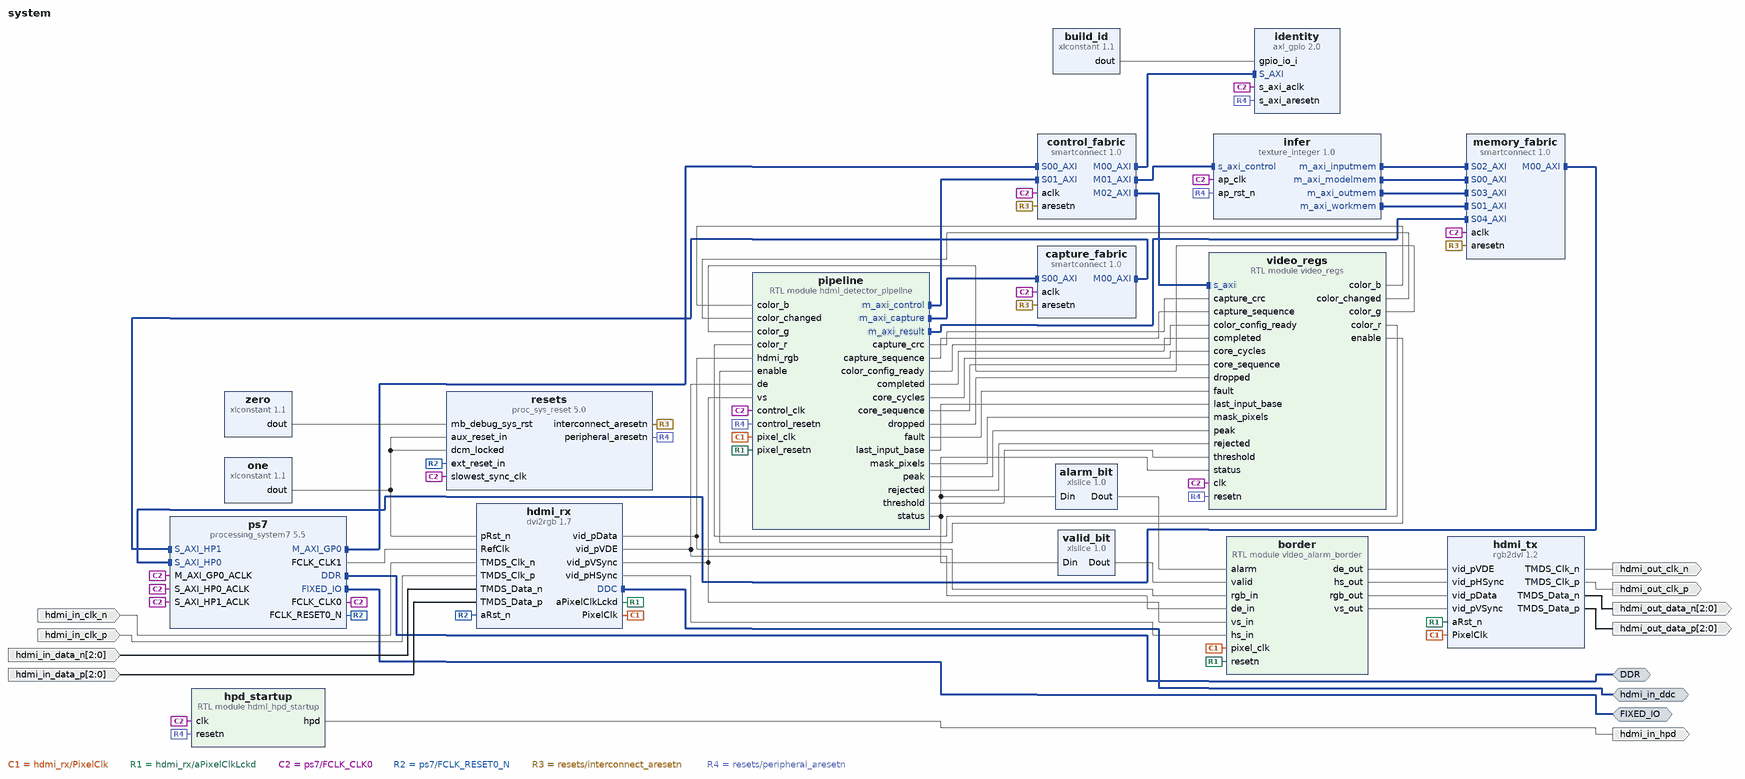
[diagram p0: block diagram of the top level]
# Vivado block design system, xc7z020clg400-1, Vivado 2025.2
create_bd_design system

create_bd_intf_port -mode Master -vlnv xilinx.com:interface:ddrx_rtl:1.0 DDR
create_bd_intf_port -mode Master -vlnv xilinx.com:display_processing_system7:fixedio_rtl:1.0 FIXED_IO
create_bd_intf_port -mode Master -vlnv xilinx.com:interface:iic_rtl:1.0 hdmi_in_ddc
create_bd_port -dir I hdmi_in_clk_p
create_bd_port -dir I hdmi_in_clk_n
create_bd_port -dir I -from 2 -to 0 hdmi_in_data_p
create_bd_port -dir I -from 2 -to 0 hdmi_in_data_n
create_bd_port -dir O hdmi_out_clk_p
create_bd_port -dir O hdmi_out_clk_n
create_bd_port -dir O -from 2 -to 0 hdmi_out_data_p
create_bd_port -dir O -from 2 -to 0 hdmi_out_data_n
create_bd_port -dir O hdmi_in_hpd

create_bd_cell -type ip -vlnv xilinx.com:ip:processing_system7:5.5 ps7
set_property -dict [list \
  CONFIG.PCW_APU_PERIPHERAL_FREQMHZ 650 \
  CONFIG.PCW_CRYSTAL_PERIPHERAL_FREQMHZ 50 \
  CONFIG.PCW_ENET0_ENET0_IO {MIO 16 .. 27} \
  CONFIG.PCW_ENET0_GRP_MDIO_ENABLE 1 \
  CONFIG.PCW_ENET0_GRP_MDIO_IO {MIO 52 .. 53} \
  CONFIG.PCW_ENET0_PERIPHERAL_ENABLE 1 \
  CONFIG.PCW_ENET0_RESET_ENABLE 1 \
  CONFIG.PCW_ENET0_RESET_IO {MIO 9} \
  CONFIG.PCW_ENET_RESET_ENABLE 1 \
  CONFIG.PCW_ENET_RESET_SELECT {Share reset pin} \
  CONFIG.PCW_EN_CLK1_PORT 1 \
  CONFIG.PCW_FPGA0_PERIPHERAL_FREQMHZ 100 \
  CONFIG.PCW_FPGA1_PERIPHERAL_FREQMHZ 200 \
  CONFIG.PCW_FPGA2_PERIPHERAL_FREQMHZ 200 \
  CONFIG.PCW_FPGA3_PERIPHERAL_FREQMHZ 166.67 \
  CONFIG.PCW_FPGA_FCLK1_ENABLE 1 \
  CONFIG.PCW_GPIO_MIO_GPIO_ENABLE 1 \
  CONFIG.PCW_GPIO_MIO_GPIO_IO MIO \
  CONFIG.PCW_I2C_RESET_ENABLE 1 \
  CONFIG.PCW_IRQ_F2P_INTR 1 \
  CONFIG.PCW_PERIPHERAL_BOARD_PRESET None \
  CONFIG.PCW_PRESET_BANK1_VOLTAGE {LVCMOS 1.8V} \
  CONFIG.PCW_QSPI_GRP_FBCLK_ENABLE 1 \
  CONFIG.PCW_QSPI_GRP_FBCLK_IO {MIO 8} \
  CONFIG.PCW_QSPI_GRP_SINGLE_SS_ENABLE 1 \
  CONFIG.PCW_QSPI_GRP_SINGLE_SS_IO {MIO 1 .. 6} \
  CONFIG.PCW_QSPI_PERIPHERAL_ENABLE 1 \
  CONFIG.PCW_QSPI_QSPI_IO {MIO 1 .. 6} \
  CONFIG.PCW_SD0_GRP_CD_ENABLE 1 \
  CONFIG.PCW_SD0_GRP_CD_IO {MIO 47} \
  CONFIG.PCW_SD0_GRP_WP_ENABLE 0 \
  CONFIG.PCW_SD0_PERIPHERAL_ENABLE 1 \
  CONFIG.PCW_SD0_SD0_IO {MIO 40 .. 45} \
  CONFIG.PCW_SDIO_PERIPHERAL_FREQMHZ 50 \
  CONFIG.PCW_SINGLE_QSPI_DATA_MODE x4 \
  CONFIG.PCW_UART0_PERIPHERAL_ENABLE 1 \
  CONFIG.PCW_UART0_UART0_IO {MIO 14 .. 15} \
  CONFIG.PCW_UART1_PERIPHERAL_ENABLE 0 \
  CONFIG.PCW_UART_PERIPHERAL_FREQMHZ 100 \
  CONFIG.PCW_UIPARAM_DDR_BUS_WIDTH {16 Bit} \
  CONFIG.PCW_UIPARAM_DDR_FREQ_MHZ 525 \
  CONFIG.PCW_UIPARAM_DDR_PARTNO {MT41J256M16 RE-125} \
  CONFIG.PCW_USB0_PERIPHERAL_ENABLE 1 \
  CONFIG.PCW_USB0_RESET_ENABLE 1 \
  CONFIG.PCW_USB0_RESET_IO {MIO 46} \
  CONFIG.PCW_USB0_USB0_IO {MIO 28 .. 39} \
  CONFIG.PCW_USB_RESET_ENABLE 1 \
  CONFIG.PCW_USB_RESET_SELECT {Share reset pin} \
  CONFIG.PCW_USE_FABRIC_INTERRUPT 1 \
  CONFIG.PCW_USE_S_AXI_HP0 1 \
  CONFIG.PCW_USE_S_AXI_HP1 1 \
] [get_bd_cells ps7]
# 493 more settings of ps7 are not shown: defaults, MIO pin electricals, DDR timing, and values the tool derives
create_bd_cell -type ip -vlnv xilinx.com:hls:texture_integer:1.0 infer
create_bd_cell -type ip -vlnv xilinx.com:ip:axi_gpio:2.0 identity
set_property -dict {CONFIG.C_ALL_INPUTS 1 CONFIG.C_GPIO_WIDTH 32} [get_bd_cells identity]
create_bd_cell -type ip -vlnv xilinx.com:ip:xlconstant:1.1 build_id
set_property -dict {CONFIG.CONST_VAL 385875969 CONFIG.CONST_WIDTH 32} [get_bd_cells build_id]
create_bd_cell -type ip -vlnv xilinx.com:ip:smartconnect:1.0 control_fabric
set_property -dict {CONFIG.NUM_CLKS 1 CONFIG.NUM_MI 3 CONFIG.NUM_SI 2} [get_bd_cells control_fabric]
create_bd_cell -type ip -vlnv xilinx.com:ip:smartconnect:1.0 memory_fabric
set_property -dict {CONFIG.NUM_CLKS 1 CONFIG.NUM_MI 1 CONFIG.NUM_SI 5} [get_bd_cells memory_fabric]
create_bd_cell -type ip -vlnv xilinx.com:ip:proc_sys_reset:5.0 resets
set_property -dict {CONFIG.C_AUX_RESET_HIGH 0} [get_bd_cells resets]
create_bd_cell -type ip -vlnv xilinx.com:ip:xlconstant:1.1 zero
set_property -dict {CONFIG.CONST_VAL 0} [get_bd_cells zero]
create_bd_cell -type ip -vlnv xilinx.com:ip:xlconstant:1.1 one
set_property -dict {CONFIG.CONST_VAL 1} [get_bd_cells one]
create_bd_cell -type module -reference hdmi_detector_pipeline pipeline
create_bd_cell -type module -reference video_regs video_regs
create_bd_cell -type ip -vlnv xilinx.com:ip:smartconnect:1.0 capture_fabric
set_property -dict {CONFIG.NUM_CLKS 1 CONFIG.NUM_MI 1 CONFIG.NUM_SI 1} [get_bd_cells capture_fabric]
create_bd_cell -type ip -vlnv digilentinc.com:ip:dvi2rgb:1.7 hdmi_rx
set_property -dict [list \
  CONFIG.kAddBUFG true \
  CONFIG.kClkRange 2 \
  CONFIG.kEdidFileName 720p_edid.data \
  CONFIG.kEmulateDDC true \
  CONFIG.kEnableSerialClkOutput true \
  CONFIG.kRstActiveHigh false \
] [get_bd_cells hdmi_rx]
create_bd_cell -type ip -vlnv digilentinc.com:ip:rgb2dvi:1.2 hdmi_tx
set_property -dict {CONFIG.kClkRange 2 CONFIG.kGenerateSerialClk true CONFIG.kRstActiveHigh false} [get_bd_cells hdmi_tx]
create_bd_cell -type module -reference video_alarm_border border
create_bd_cell -type ip -vlnv xilinx.com:ip:xlslice:1.0 alarm_bit
set_property -dict {CONFIG.DIN_FROM 2 CONFIG.DIN_TO 2 CONFIG.DIN_WIDTH 32 CONFIG.DOUT_WIDTH 1} [get_bd_cells alarm_bit]
create_bd_cell -type ip -vlnv xilinx.com:ip:xlslice:1.0 valid_bit
set_property -dict {CONFIG.DIN_FROM 3 CONFIG.DIN_TO 3 CONFIG.DIN_WIDTH 32 CONFIG.DOUT_WIDTH 1} [get_bd_cells valid_bit]
create_bd_cell -type module -reference hdmi_hpd_startup hpd_startup
set_property -dict {CONFIG.STARTUP_CYCLES 20000000} [get_bd_cells hpd_startup]

# ---- connections ----

connect_bd_intf_net [get_bd_intf_pins capture_fabric/M00_AXI] [get_bd_intf_pins ps7/S_AXI_HP1]
connect_bd_intf_net [get_bd_intf_pins control_fabric/M00_AXI] [get_bd_intf_pins identity/S_AXI]
connect_bd_intf_net [get_bd_intf_pins control_fabric/M01_AXI] [get_bd_intf_pins infer/s_axi_control]
connect_bd_intf_net [get_bd_intf_pins control_fabric/M02_AXI] [get_bd_intf_pins video_regs/s_axi]
connect_bd_intf_net [get_bd_intf_ports hdmi_in_ddc] [get_bd_intf_pins hdmi_rx/DDC]
connect_bd_intf_net [get_bd_intf_pins infer/m_axi_inputmem] [get_bd_intf_pins memory_fabric/S02_AXI]
connect_bd_intf_net [get_bd_intf_pins infer/m_axi_modelmem] [get_bd_intf_pins memory_fabric/S00_AXI]
connect_bd_intf_net [get_bd_intf_pins infer/m_axi_outmem] [get_bd_intf_pins memory_fabric/S03_AXI]
connect_bd_intf_net [get_bd_intf_pins infer/m_axi_workmem] [get_bd_intf_pins memory_fabric/S01_AXI]
connect_bd_intf_net [get_bd_intf_pins memory_fabric/M00_AXI] [get_bd_intf_pins ps7/S_AXI_HP0]
connect_bd_intf_net [get_bd_intf_pins pipeline/m_axi_capture] [get_bd_intf_pins capture_fabric/S00_AXI]
connect_bd_intf_net [get_bd_intf_pins pipeline/m_axi_control] [get_bd_intf_pins control_fabric/S01_AXI]
connect_bd_intf_net [get_bd_intf_pins pipeline/m_axi_result] [get_bd_intf_pins memory_fabric/S04_AXI]
connect_bd_intf_net [get_bd_intf_ports DDR] [get_bd_intf_pins ps7/DDR]
connect_bd_intf_net [get_bd_intf_ports FIXED_IO] [get_bd_intf_pins ps7/FIXED_IO]
connect_bd_intf_net [get_bd_intf_pins ps7/M_AXI_GP0] [get_bd_intf_pins control_fabric/S00_AXI]
connect_bd_net [get_bd_pins alarm_bit/Dout] [get_bd_pins border/alarm]
connect_bd_net [get_bd_pins border/de_out] [get_bd_pins hdmi_tx/vid_pVDE]
connect_bd_net [get_bd_pins border/hs_out] [get_bd_pins hdmi_tx/vid_pHSync]
connect_bd_net [get_bd_pins border/rgb_out] [get_bd_pins hdmi_tx/vid_pData]
connect_bd_net [get_bd_pins border/vs_out] [get_bd_pins hdmi_tx/vid_pVSync]
connect_bd_net [get_bd_pins build_id/dout] [get_bd_pins identity/gpio_io_i]
connect_bd_net [get_bd_ports hdmi_in_clk_n] [get_bd_pins hdmi_rx/TMDS_Clk_n]
connect_bd_net [get_bd_ports hdmi_in_clk_p] [get_bd_pins hdmi_rx/TMDS_Clk_p]
connect_bd_net [get_bd_ports hdmi_in_data_n] [get_bd_pins hdmi_rx/TMDS_Data_n]
connect_bd_net [get_bd_ports hdmi_in_data_p] [get_bd_pins hdmi_rx/TMDS_Data_p]
connect_bd_net [get_bd_pins hdmi_rx/PixelClk] [get_bd_pins pipeline/pixel_clk] [get_bd_pins border/pixel_clk] [get_bd_pins hdmi_tx/PixelClk]
connect_bd_net [get_bd_pins hdmi_rx/aPixelClkLckd] [get_bd_pins pipeline/pixel_resetn] [get_bd_pins border/resetn] [get_bd_pins hdmi_tx/aRst_n]
connect_bd_net [get_bd_pins hdmi_rx/vid_pData] [get_bd_pins pipeline/hdmi_rgb] [get_bd_pins border/rgb_in]
connect_bd_net [get_bd_pins hdmi_rx/vid_pHSync] [get_bd_pins border/hs_in]
connect_bd_net [get_bd_pins hdmi_rx/vid_pVDE] [get_bd_pins pipeline/de] [get_bd_pins border/de_in]
connect_bd_net [get_bd_pins hdmi_rx/vid_pVSync] [get_bd_pins pipeline/vs] [get_bd_pins border/vs_in]
connect_bd_net [get_bd_pins hdmi_tx/TMDS_Clk_n] [get_bd_ports hdmi_out_clk_n]
connect_bd_net [get_bd_pins hdmi_tx/TMDS_Clk_p] [get_bd_ports hdmi_out_clk_p]
connect_bd_net [get_bd_pins hdmi_tx/TMDS_Data_n] [get_bd_ports hdmi_out_data_n]
connect_bd_net [get_bd_pins hdmi_tx/TMDS_Data_p] [get_bd_ports hdmi_out_data_p]
connect_bd_net [get_bd_pins hpd_startup/hpd] [get_bd_ports hdmi_in_hpd]
connect_bd_net [get_bd_pins one/dout] [get_bd_pins resets/dcm_locked] [get_bd_pins resets/aux_reset_in] [get_bd_pins hdmi_rx/pRst_n]
connect_bd_net [get_bd_pins pipeline/capture_crc] [get_bd_pins video_regs/capture_crc]
connect_bd_net [get_bd_pins pipeline/capture_sequence] [get_bd_pins video_regs/capture_sequence]
connect_bd_net [get_bd_pins pipeline/color_config_ready] [get_bd_pins video_regs/color_config_ready]
connect_bd_net [get_bd_pins pipeline/completed] [get_bd_pins video_regs/completed]
connect_bd_net [get_bd_pins pipeline/core_cycles] [get_bd_pins video_regs/core_cycles]
connect_bd_net [get_bd_pins pipeline/core_sequence] [get_bd_pins video_regs/core_sequence]
connect_bd_net [get_bd_pins pipeline/dropped] [get_bd_pins video_regs/dropped]
connect_bd_net [get_bd_pins pipeline/fault] [get_bd_pins video_regs/fault]
connect_bd_net [get_bd_pins pipeline/last_input_base] [get_bd_pins video_regs/last_input_base]
connect_bd_net [get_bd_pins pipeline/mask_pixels] [get_bd_pins video_regs/mask_pixels]
connect_bd_net [get_bd_pins pipeline/peak] [get_bd_pins video_regs/peak]
connect_bd_net [get_bd_pins pipeline/rejected] [get_bd_pins video_regs/rejected]
connect_bd_net [get_bd_pins pipeline/status] [get_bd_pins video_regs/status] [get_bd_pins alarm_bit/Din] [get_bd_pins valid_bit/Din]
connect_bd_net [get_bd_pins pipeline/threshold] [get_bd_pins video_regs/threshold]
connect_bd_net [get_bd_pins ps7/FCLK_CLK0] \
  [get_bd_pins ps7/M_AXI_GP0_ACLK] [get_bd_pins ps7/S_AXI_HP0_ACLK] [get_bd_pins control_fabric/aclk] \
  [get_bd_pins memory_fabric/aclk] [get_bd_pins identity/s_axi_aclk] [get_bd_pins infer/ap_clk] \
  [get_bd_pins resets/slowest_sync_clk] [get_bd_pins pipeline/control_clk] [get_bd_pins video_regs/clk] \
  [get_bd_pins capture_fabric/aclk] [get_bd_pins ps7/S_AXI_HP1_ACLK] [get_bd_pins hpd_startup/clk]
connect_bd_net [get_bd_pins ps7/FCLK_CLK1] [get_bd_pins hdmi_rx/RefClk]
connect_bd_net [get_bd_pins ps7/FCLK_RESET0_N] [get_bd_pins resets/ext_reset_in] [get_bd_pins hdmi_rx/aRst_n]
connect_bd_net [get_bd_pins resets/interconnect_aresetn] \
  [get_bd_pins control_fabric/aresetn] [get_bd_pins memory_fabric/aresetn] [get_bd_pins capture_fabric/aresetn]
connect_bd_net [get_bd_pins resets/peripheral_aresetn] \
  [get_bd_pins identity/s_axi_aresetn] [get_bd_pins infer/ap_rst_n] [get_bd_pins pipeline/control_resetn] \
  [get_bd_pins video_regs/resetn] [get_bd_pins hpd_startup/resetn]
connect_bd_net [get_bd_pins valid_bit/Dout] [get_bd_pins border/valid]
connect_bd_net [get_bd_pins video_regs/color_b] [get_bd_pins pipeline/color_b]
connect_bd_net [get_bd_pins video_regs/color_changed] [get_bd_pins pipeline/color_changed]
connect_bd_net [get_bd_pins video_regs/color_g] [get_bd_pins pipeline/color_g]
connect_bd_net [get_bd_pins video_regs/color_r] [get_bd_pins pipeline/color_r]
connect_bd_net [get_bd_pins video_regs/enable] [get_bd_pins pipeline/enable]
connect_bd_net [get_bd_pins zero/dout] [get_bd_pins resets/mb_debug_sys_rst]

# ---- address map ----
assign_bd_address -offset 0x0000000000000000 -range 512M -target_address_space [get_bd_addr_spaces infer/Data_m_axi_inputmem] [get_bd_addr_segs ps7/S_AXI_HP0/HP0_DDR_LOWOCM]
assign_bd_address -offset 0x0000000000000000 -range 512M -target_address_space [get_bd_addr_spaces infer/Data_m_axi_modelmem] [get_bd_addr_segs ps7/S_AXI_HP0/HP0_DDR_LOWOCM]
assign_bd_address -offset 0x0000000000000000 -range 512M -target_address_space [get_bd_addr_spaces infer/Data_m_axi_outmem] [get_bd_addr_segs ps7/S_AXI_HP0/HP0_DDR_LOWOCM]
assign_bd_address -offset 0x0000000000000000 -range 512M -target_address_space [get_bd_addr_spaces infer/Data_m_axi_workmem] [get_bd_addr_segs ps7/S_AXI_HP0/HP0_DDR_LOWOCM]
assign_bd_address -offset 0x00000000 -range 512M -target_address_space [get_bd_addr_spaces pipeline/m_axi_capture] [get_bd_addr_segs ps7/S_AXI_HP1/HP1_DDR_LOWOCM]
assign_bd_address -offset 0x41200000 -range 64K -target_address_space [get_bd_addr_spaces pipeline/m_axi_control] [get_bd_addr_segs identity/S_AXI/Reg]
assign_bd_address -offset 0x43C10000 -range 64K -target_address_space [get_bd_addr_spaces pipeline/m_axi_control] [get_bd_addr_segs infer/s_axi_control/Reg]
assign_bd_address -offset 0x43C20000 -range 4K -target_address_space [get_bd_addr_spaces pipeline/m_axi_control] [get_bd_addr_segs video_regs/s_axi/reg0]
assign_bd_address -offset 0x00000000 -range 512M -target_address_space [get_bd_addr_spaces pipeline/m_axi_result] [get_bd_addr_segs ps7/S_AXI_HP0/HP0_DDR_LOWOCM]
assign_bd_address -offset 0x41200000 -range 64K -target_address_space [get_bd_addr_spaces ps7/Data] [get_bd_addr_segs identity/S_AXI/Reg]
assign_bd_address -offset 0x43C10000 -range 64K -target_address_space [get_bd_addr_spaces ps7/Data] [get_bd_addr_segs infer/s_axi_control/Reg]
assign_bd_address -offset 0x43C20000 -range 4K -target_address_space [get_bd_addr_spaces ps7/Data] [get_bd_addr_segs video_regs/s_axi/reg0]

validate_bd_design
save_bd_design
